# Altium schematic sheet Power-Sheet.SchDoc
size 420 x 297 mm; SheetNumber: 2; SheetTotal: 6
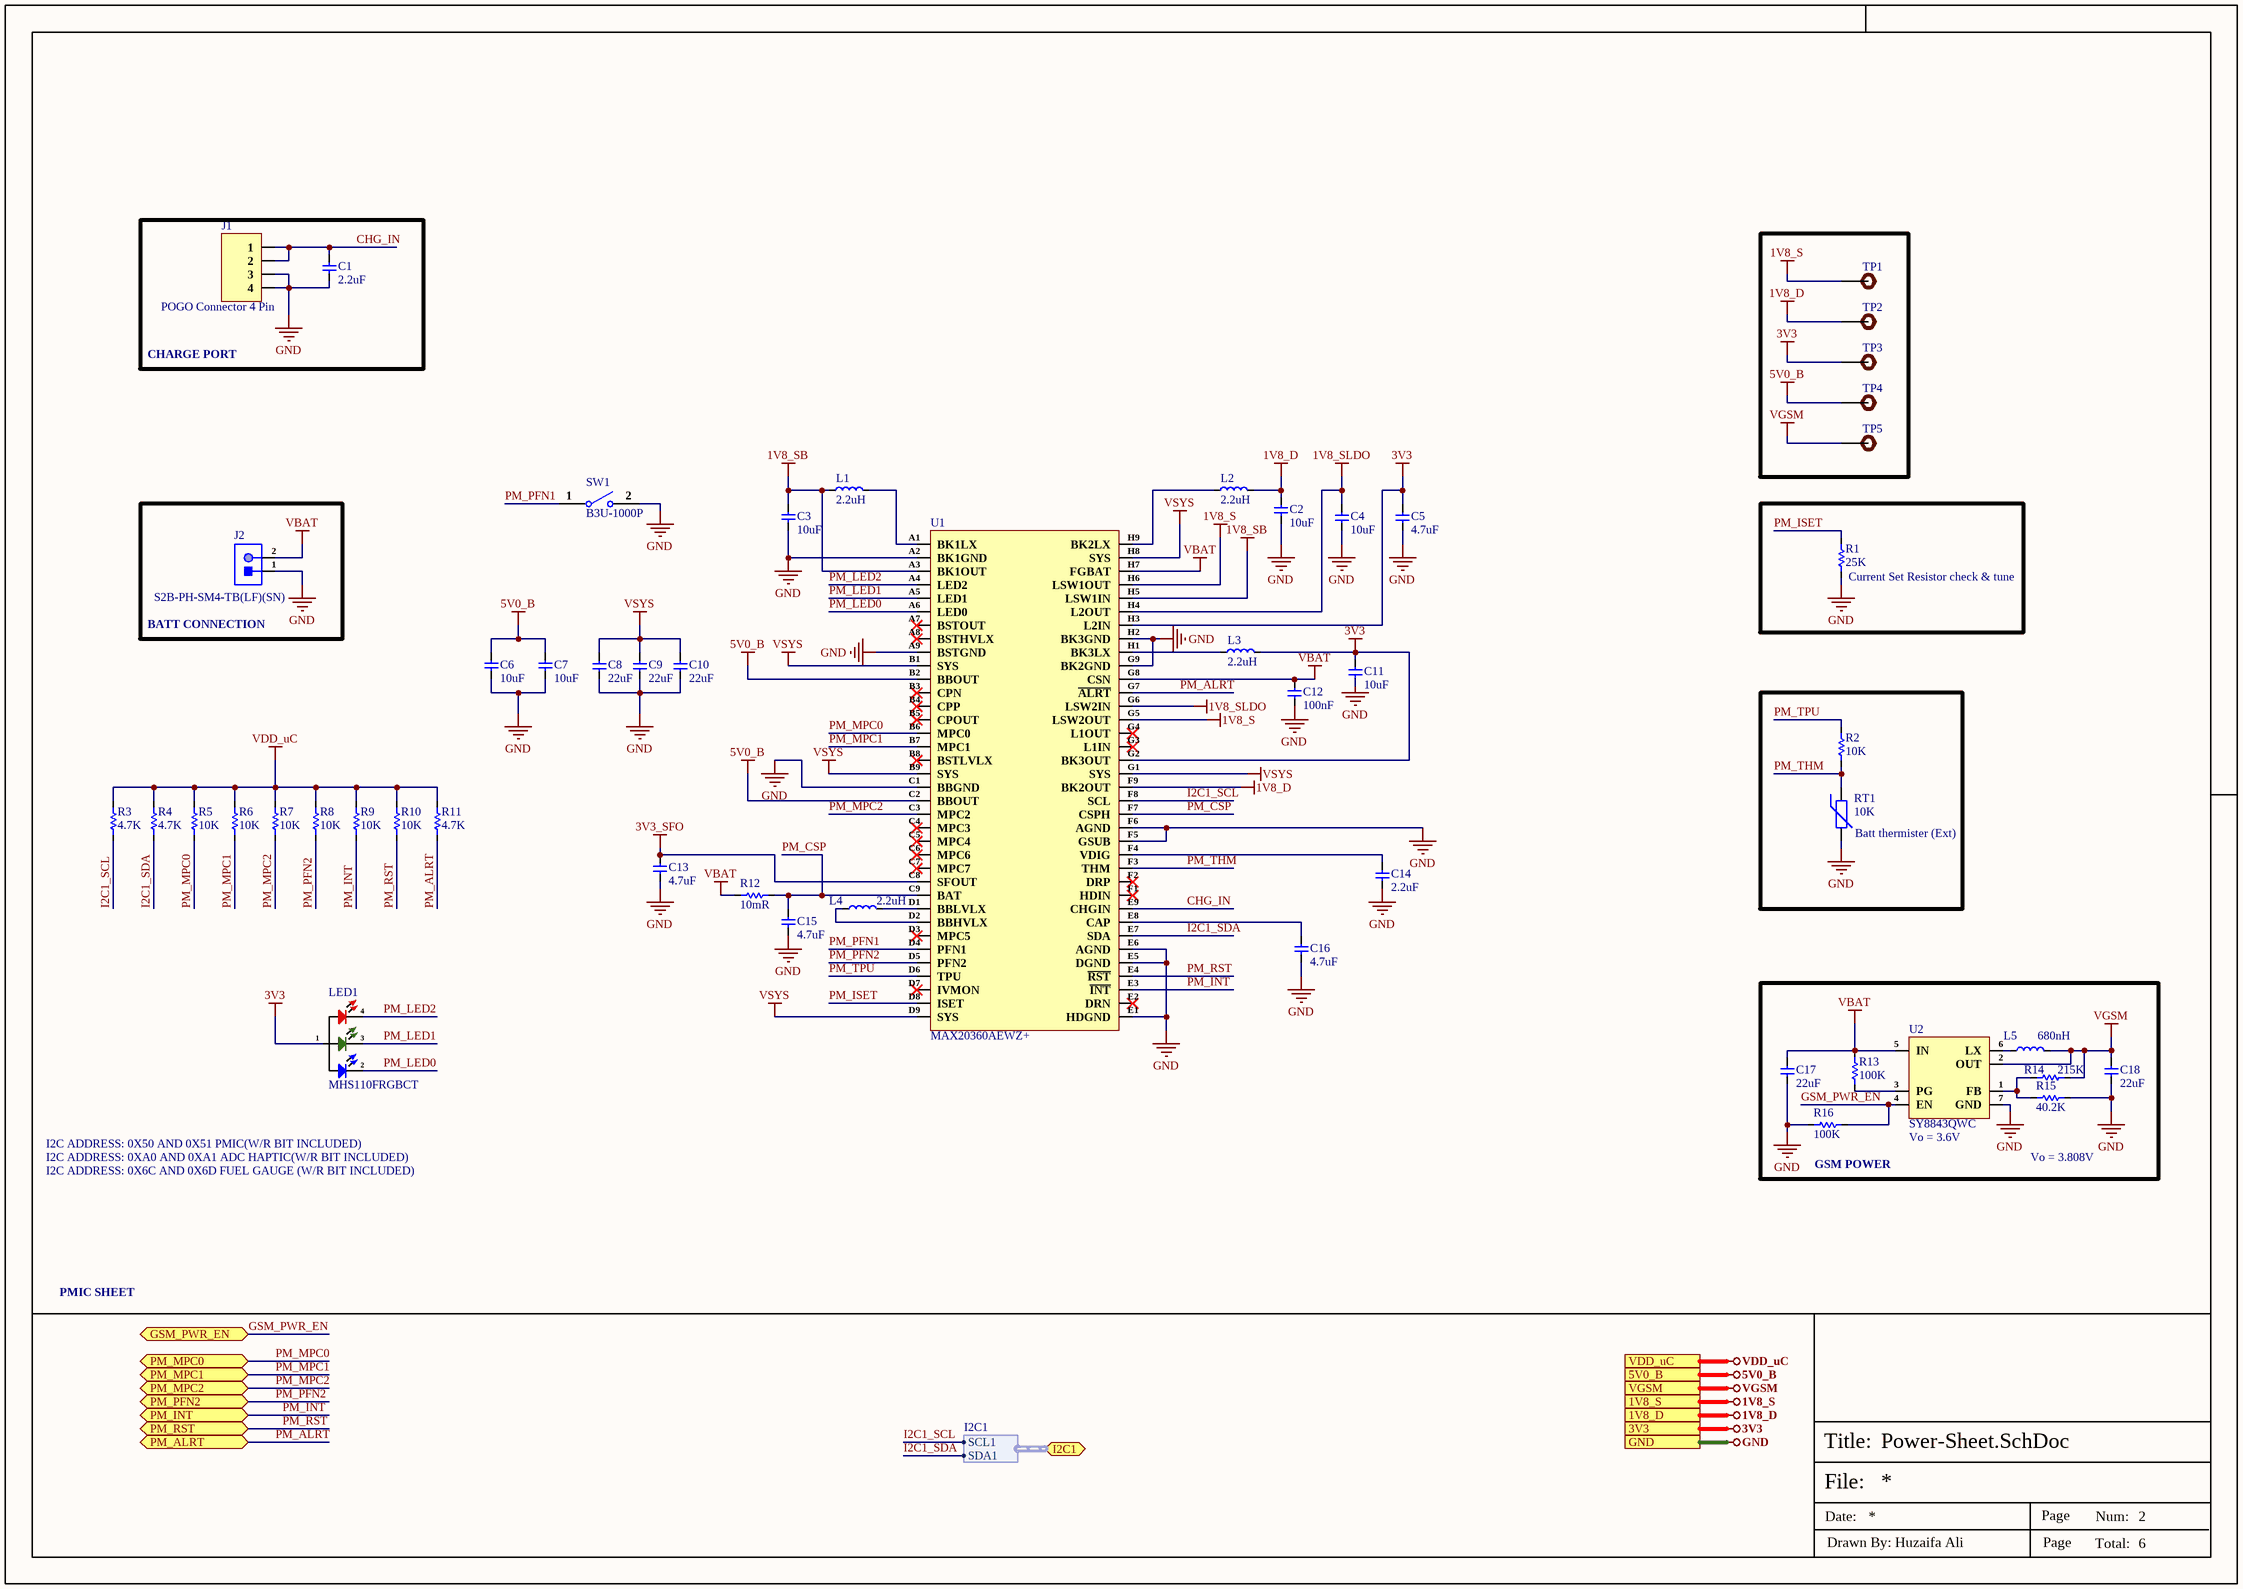
[diagram p0: Power-Sheet.SchDoc]

## Parts
C1  2.2uF  [Cap-0402]
C2  10uF  [Cap-0603]
C3  10uF  [Cap-0603]
C4  10uF  [Cap-0603]
C5  4.7uF  [Cap-0402]
C6  10uF  [Cap-0603]
C7  10uF  [Cap-0603]
C8  22uF  [Cap-0603]
C9  22uF  [Cap-0603]
C10  22uF  [Cap-0603]
C11  10uF  [Cap-0603]
C12  100nF  [Cap-0402]
C13  4.7uF  [Cap-0402]
C14  2.2uF  [Cap-0402]
C15  4.7uF  [Cap-0402]
C16  4.7uF  [Cap-0402]
C17  22uF  [Cap-0603]
C18  22uF  [Cap-0603]
J1  POGO Connector 4 Pin  [Pogo 4 Pin]
J2  S2B-PH-SM4-TB(LF)(SN)  [S2B-PH-SM4-TB(LF)(SN)]
L1  2.2uH  [IND-0806]
L2  2.2uH  [IND-0806]
L3  2.2uH  [IND-0806]
L4  2.2uH  [IND-0806]
L5  680nH  [UHP252012NF-R68MT01]
LED1  MHS110FRGBCT  [MHS110FRGBCT]
R1  25K  [Res-0603]
R2  10K  [Res-0402]
R3  4.7K  [Res-0201]
R4  4.7K  [Res-0201]
R5  10K  [Res-0402]
R6  10K  [Res-0402]
R7  10K  [Res-0402]
R8  10K  [Res-0402]
R9  10K  [Res-0402]
R10  10K  [Res-0402]
R11  4.7K  [Res-0402]
R12  10mR  [Res-0402]
R13  100K  [Res-0402]
R14  215K  [Res-0603]
R15  40.2K  [Res-0402]
R16  100K  [Res-0402]
RT1  10K  [Res-0201]
SW1  B3U-1000P  [B3U-1000P]
TP1  TEST POINT 0.5mm Dia  [Test-point - 0.5mm]  (value not drawn)  (no BOM)
TP2  TEST POINT 0.5mm Dia  [Test-point - 0.5mm]  (value not drawn)  (no BOM)
TP3  TEST POINT 0.5mm Dia  [Test-point - 0.5mm]  (value not drawn)  (no BOM)
TP4  TEST POINT 0.5mm Dia  [Test-point - 0.5mm]  (value not drawn)  (no BOM)
TP5  TEST POINT 0.5mm Dia  [Test-point - 0.5mm]  (value not drawn)  (no BOM)
U1  MAX20360AEWZ+  [72-WLP (4.88x4.19)]
U2  SY8843QWC  [QFN-7(1.5x1.5)]

## Blocks framed on the sheet
CHARGE PORT: C1 J1
BATT CONNECTION: J2
Current Set Resistor check & tune: R1
Batt thermister (Ext): R2 RT1

## Ports
1V8_D (see Top-Sheet[2B], Sensor-Sheet[5D]), 1V8_S (see Top-Sheet[2B], Controller-Sheet[5D], Sensor-Sheet[5D], Temp-Sensor-Sheet[3D]), 3V3 (see Top-Sheet[2B], Controller-Sheet[5D], Sensor-Sheet[5D]), 5V0_B (see Top-Sheet[2A], Controller-Sheet[5D], Sensor-Sheet[5D]), GND (see Top-Sheet[2A], Controller-Sheet[5D], GSM-Sheet[5D], Sensor-Sheet[5D], Temp-Sensor-Sheet[3D]), GSM_PWR_EN (bidir, see Top-Sheet[2B], Controller-Sheet[1D]), I2C1 (bidir, harness I2C1, see Top-Sheet[2B], Controller-Sheet[4D], Temp-Sensor-Sheet[2D]), PM_ALRT (bidir, see Top-Sheet[2B], Controller-Sheet[1D]), PM_INT (bidir, see Top-Sheet[2B], Controller-Sheet[1D]), PM_MPC0 (bidir, see Top-Sheet[2A], Controller-Sheet[1D]), PM_MPC1 (bidir, see Top-Sheet[2A], Controller-Sheet[1D]), PM_MPC2 (bidir, see Top-Sheet[2B], Controller-Sheet[1D]), PM_PFN2 (bidir, see Top-Sheet[2B], Controller-Sheet[1D]), PM_RST (bidir, see Top-Sheet[2B], Controller-Sheet[1D]), VDD_uC (see Top-Sheet[2B], Controller-Sheet[5D], GSM-Sheet[5D]), VGSM (see Top-Sheet[2B], GSM-Sheet[5D])

## Harnesses
I2C1: SCL1, SDA1

## Nets
1V8_D: C2.1 L2.2 TP2.1 U1.F9(BK2OUT) ; port 1V8_D
1V8_S: TP1.1 U1.G5(LSW2OUT) U1.H6(LSW1OUT) ; port 1V8_S
1V8_SB: C3.1 L1.1 U1.A3(BK1OUT) U1.H5(LSW1IN)
1V8_SLDO: C4.2 U1.G6(LSW2IN) U1.H4(L2OUT)
3V3: C5.2 C11.1 L3.2 LED1.1(+) TP3.1 U1.G2(BK3OUT) U1.H3(L2IN) ; port 3V3
3V3_SFO: C13.2 U1.C8(SFOUT)
5V0_B: C6.1 C7.1 TP4.1 U1.B2(BBOUT) U1.C2(BBOUT) ; port 5V0_B
GND: C1.1 C2.2 C3.2 C4.1 C5.1 C6.2 C7.2 C8.1 C9.1 C10.1 C11.2 C12.1 C13.1 C14.1 C15.2 C16.2 C17.1 C18.1 J1.3 J1.4 J2.1 R1.1 R15.2 R16.2 RT1.2 SW1.2 U1.A2(BK1GND) U1.A9(BSTGND) U1.C1(BBGND) U1.E1(HDGND) U1.E5(DGND) U1.E6(AGND) U1.F5(GSUB) U1.F6(AGND) U1.G9(BK2GND) U1.H2(BK3GND) U2.7(GND) ; port GND
VBAT: C12.2 C17.2 J2.2 R12.1 R13.2 U1.G8(CSN) U1.H7(FGBAT) U2.5(IN)
VDD_uC: R3.2 R4.2 R5.2 R6.2 R7.2 R8.2 R9.2 R10.2 R11.2 ; port VDD_uC
VGSM: C18.2 L5.2 R14.2 TP5.1 U2.2(OUT) ; port VGSM
VSYS: C8.2 C9.2 C10.2 U1.B1(SYS) U1.B9(SYS) U1.D9(SYS) U1.G1(SYS) U1.H8(SYS)
CHG_IN: C1.2 J1.1 J1.2 U1.E9(CHGIN)
GSM_PWR_EN: R16.1 U2.4(EN) ; port GSM_PWR_EN
I2C1_SCL: R3.1 U1.F8(SCL) ; port I2C1.SCL1
I2C1_SDA: R4.1 U1.E7(SDA) ; port I2C1.SDA1
PM_ALRT: R11.1 U1.G7(~{ALRT}) ; port PM_ALRT
PM_CSP: C15.1 R12.2 U1.C9(BAT) U1.F7(CSPH)
PM_INT: R9.1 U1.E3(~{INT}) ; port PM_INT
PM_ISET: R1.2 U1.D8(ISET)
PM_LED0: LED1.2(-BLUE) U1.A6(LED0)
PM_LED1: LED1.3(-GREEN) U1.A5(LED1)
PM_LED2: LED1.4(-RED) U1.A4(LED2)
PM_MPC0: R5.1 U1.B6(MPC0) ; port PM_MPC0
PM_MPC1: R6.1 U1.B7(MPC1) ; port PM_MPC1
PM_MPC2: R7.1 U1.C3(MPC2) ; port PM_MPC2
PM_PFN1: SW1.1 U1.D4(PFN1)
PM_PFN2: R8.1 U1.D5(PFN2) ; port PM_PFN2
PM_RST: R10.1 U1.E4(~{RST}) ; port PM_RST
PM_THM: R2.1 RT1.1 U1.F3(THM)
PM_TPU: R2.2 U1.D6(TPU)
NetC14_2: C14.2 U1.F4(VDIG)
NetC16_1: C16.1 U1.E8(CAP)
NetL1_2: L1.2 U1.A1(BK1LX)
NetL2_1: L2.1 U1.H9(BK2LX)
NetL3_1: L3.1 U1.H1(BK3LX)
NetL4_1: L4.1 U1.D2(BBHVLX)
NetL4_2: L4.2 U1.D1(BBLVLX)
NetL5_1: L5.1 U2.6(LX)
NetR13_1: R13.1 U2.3(PG)
NetR14_1: R14.1 R15.1 U2.1(FB)

Not connected (* = marked no-connect by the designer): U1 A7(BSTOUT)* A8(BSTHVLX)* B3(CPN)* B4(CPP)* B5(CPOUT)* B8(BSTLVLX)* C4(MPC3)* C5(MPC4)* C6(MPC6)* C7(MPC7)* D3(MPC5)* D7(IVMON)* E2(DRN)* F1(HDIN)* F2(DRP)* G3(L1IN)* G4(L1OUT)*

## Notes on the sheet
- I2C ADDRESS: 0X50 AND 0X51 PMIC(W/R BIT INCLUDED)
- I2C ADDRESS: 0XA0 AND 0XA1 ADC HAPTIC(W/R BIT INCLUDED)
- I2C ADDRESS: 0X6C AND 0X6D FUEL GAUGE (W/R BIT INCLUDED)
- (near R16) GSM POWER
- (near U2) Vo = 3.6V
- Vo = 3.808V
- PMIC SHEET
- File:
- Title:
- Date:
- Page
- Num:
- Total:
- Drawn By: Huzaifa Ali

## Library data of the parts
C1 = C1005X5R1V225K050BC: CAP CER 2.2UF 35V X5R 0402; Manufacturer: TDK; Item Type: Capacitors; Dielectric Material: Ceramic; Material: 4241ConductorMaterial; Tolerance: 10%; Supplier: Digikey; Supplier Part Number: 445-9028-1-ND; Manufacturer Part Number: C1005X5R1V225K050BC; RoHS: Yes; Stock: 1458755; Pricing: 1=0.21, 10=0.123, 50=0.0866, 100=0.0754, 500=0.05646, 1000=0.05055, 2500=0.04429, 5000=0.04049 (USD); Mounting Technology: Surface Mount; Case/Package: 0402; Case Code (Imperial): 0402; Case Code (Metric): 1005; Weight: 2.3E-05oz; Min Operating Temperature: -55°C; Max Operating Temperature: 85°C; Packaging: Tape and Reel; Voltage Rating: 35V; Value: 2.2uF; Voltage Rating (DC): 35V; Package Quantity: 1; Dielectric: X5R; Termination: SMD/SMT; Series: C; Length: 1mm; Width: 0.02inch; Height: 0.5mm; Thickness: 0.022inch; Depth: 0.5mm; Lead Free: Lead Free; RoHS Compliant: Yes; Reach SVHC Compliant: Unknown; ComponentLink1URL: https://datasheet.ciiva.com/24218/mlcc-commercial-general-en-24218938.pdf?src-supplier=Mouser; ComponentLink1Description: https://datasheet.ciiva.com/24218/mlcc-commercial-general-en-24218938.pdf?src-supplier=Mouser
C2-C4 C6 C7 C11 = GRT188R61E106ME13D: CAP CER 10UF 25V X5R 0603; Manufacturer: Murata; Item Type: Capacitors; Material: 4241ConductorMaterial; Tolerance: 20%; Supplier: Future Electronics; LCSC Part Number: C697423; Manufacturer Part Number: GRT188R61E106ME13D; RoHS: No; Stock: 444000; Pricing: 4000=0.0522, 8000=0.0514, 12000=0.0509, 20000=0.0503, 40000=0.049 (USD); Mounting Technology: Surface Mount; Case/Package: 0603; Case Code (Metric): 1608; Case Code (Imperial): 0603; Weight: 0.000917oz; Min Operating Temperature: -55°C; Max Operating Temperature: 85°C; Packaging: Cut Tape; Value: 10uF; Voltage Rating: 25V; Series: GRT; Termination: Standard; Voltage Rating (DC): 25V; Dielectric: X5R; Package Quantity: 4000; Length: 1.6mm; Width: 0.8mm; Height: 0.8mm; Ratings: AEC-Q200; RoHS Compliant: No; ComponentLink1URL: https://datasheet.octopart.com/GRT188R61E106ME13D-Murata-datasheet-149523595.pdf?src-supplier=Newark; ComponentLink1Description: https://datasheet.octopart.com/GRT188R61E106ME13D-Murata-datasheet-149523595.pdf?src-supplier=Newark; ComponentLink2URL: https://datasheet.octopart.com/GRT188R61E106ME13D-Murata-datasheet-82944876.pdf?src-supplier=Future+Electronics; ComponentLink2Description: https://datasheet.octopart.com/GRT188R61E106ME13D-Murata-datasheet-82944876.pdf?src-supplier=Future+Electronics; ComponentLink3URL: http://search.murata.co.jp/Ceramy/image/img/A01X/G101/ENG/GRT188R61E106ME13-01.pdf?src-supplier=Digikey; ComponentLink3Description: http://search.murata.co.jp/Ceramy/image/img/A01X/G101/ENG/GRT188R61E106ME13-01.pdf?src-supplier=Digikey; ComponentLink4URL: https://search.murata.co.jp/Ceramy/image/img/A01X/G101/ENG/GRT188R61E106ME13-01.pdf?src-supplier=Digikey; ComponentLink4Description: https://search.murata.co.jp/Ceramy/image/img/A01X/G101/ENG/GRT188R61E106ME13-01.pdf?src-supplier=Digikey; ComponentLink5URL: https://datasheet.octopart.com/GRT188R61E106ME13D-Murata-datasheet-165579666.pdf?src-supplier=TME; ComponentLink5Description: https://datasheet.octopart.com/GRT188R61E106ME13D-Murata-datasheet-165579666.pdf?src-supplier=TME
C5 C13 C15 C16 = C1005X5R0J475K050BC: CAP CER 4.7UF 6.3V X5R 0402; Manufacturer: TDK; Item Type: Capacitors; Material: 4241ConductorMaterial; Supplier: Digikey; Supplier Part Number: 445-5947-1-ND; Manufacturer Part Number: C1005X5R0J475K050BC; RoHS: Yes; Stock: 1033379; Pricing: 1=0.28, 10=0.165, 50=0.1178, 100=0.1032, 500=0.0782, 1000=0.07043, 2500=0.06217, 5000=0.05716 (USD); Dielectric Material: 4241ConductorMaterial; Lead Free: 5697LeadFree; ComponentLink1URL: https://datasheet.ciiva.com/6252/mlcc-commercial-general-en-6252115.pdf?src-supplier=Digikey; ComponentLink1Description: https://datasheet.ciiva.com/6252/mlcc-commercial-general-en-6252115.pdf?src-supplier=Digikey
C8-C10 = CL10A226MO7JZNC: CAP CER 22UF 16V X5R 0603; Manufacturer: Samsung; Item Type: Capacitors; Material: 4241ConductorMaterial; Tolerance: 20%; Supplier: Digikey; LCSC Part Number: C2762594; Manufacturer Part Number: CL10A226MO7JZNC; RoHS: Yes; Stock: 944984; Pricing: 1=0.65, 10=0.391, 50=0.2884, 100=0.2564, 500=0.20198, 1000=0.18499 (USD); Mounting Technology: Surface Mount; Case/Package: 0603; Case Code (Imperial): 0603; Case Code (Metric): 1608; Min Operating Temperature: -55°C; Max Operating Temperature: 85°C; Packaging: Cut Tape; Value: 22uF; Voltage Rating: 16V; Series: CL; Height: 900um; RoHS Compliant: Yes; ComponentLink1URL: http://www.samsungsem.com/kr/support/product-search/mlcc/CL10A226MO7JZNC.jsp?src-supplier=Digikey; ComponentLink1Description: http://www.samsungsem.com/kr/support/product-search/mlcc/CL10A226MO7JZNC.jsp?src-supplier=Digikey; ComponentLink2URL: https://datasheet.octopart.com/CL10A226MO7JZNC-Samsung-Electro-Mechanics-datasheet-149156497.pdf?src-supplier=Future+Electronics; ComponentLink2Description: https://datasheet.octopart.com/CL10A226MO7JZNC-Samsung-Electro-Mechanics-datasheet-149156497.pdf?src-supplier=Future+Electronics
C12 = GRM155R71H104KE14D: CAP CER 0.1UF 50V X7R 0402; Manufacturer: Murata; Item Type: Capacitors; Material: Ceramic; Tolerance: 10%; Dissipation Factor: 0.025%; Supplier: Future Electronics; LCSC Part Number: C77020; Manufacturer Part Number: GRM155R71H104KE14D; RoHS: Yes; Stock: 45820000; Pricing: 10000=0.0034, 40000=0.0033, 150000=0.0032, 250000=0.0031, 500000=0.003 (USD); Mounting Technology: Surface Mount; Case/Package: 0402; Pins: 2NUMBER; Case Code (Metric): 1005; Case Code (Imperial): 0402; Weight: 0.000212oz; Dielectric Material: Ceramic; Min Operating Temperature: -55°C; Max Operating Temperature: 125°C; Packaging: Tape and Reel; Dielectric: X7R; Value: 100nF; Voltage Rating: 50V; Termination: SMD/SMT; Voltage: 50V; Voltage Rating (DC): 50V; Package Quantity: 10000; Series: GRM; Construction: Flat; Length: 1mm; Width: 0.5mm; Height: 0.5mm; Thickness: 0.022inch; Depth: 0.5mm; Lead Free: 5697LeadFree; Reach SVHC Compliant: No; RoHS Compliant: Yes; ComponentLink1URL: http://www.farnell.com/datasheets/2079156.pdf?src-supplier=Farnell; ComponentLink1Description: http://www.farnell.com/datasheets/2079156.pdf?src-supplier=Farnell; ComponentLink2URL: http://www.mouser.com/ds/2/281/c02e-2905.pdf?src-supplier=Mouser; ComponentLink2Description: http://www.mouser.com/ds/2/281/c02e-2905.pdf?src-supplier=Mouser; ComponentLink3URL: https://datasheet.octopart.com/GRM155R71H104KE14D-Murata-datasheet-22122223.pdf?src-supplier=Future+Electronics; ComponentLink3Description: https://datasheet.octopart.com/GRM155R71H104KE14D-Murata-datasheet-22122223.pdf?src-supplier=Future+Electronics; ComponentLink4URL: http://www.farnell.com/datasheets/2079156.pdf?src-supplier=Newark; ComponentLink4Description: http://www.farnell.com/datasheets/2079156.pdf?src-supplier=Newark; ComponentLink5URL: https://datasheet.octopart.com/GRM155R71H104KE14D-Murata-datasheet-66077078.pdf?src-supplier=Element14; ComponentLink5Description: https://datasheet.octopart.com/GRM155R71H104KE14D-Murata-datasheet-66077078.pdf?src-supplier=Element14; ComponentLink6URL: https://search.murata.co.jp/Ceramy/image/img/A01X/G101/ENG/GRM155R71H104KE14-01.pdf?src-supplier=Digikey; ComponentLink6Description: https://search.murata.co.jp/Ceramy/image/img/A01X/G101/ENG/GRM155R71H104KE14-01.pdf?src-supplier=Digikey
C14 = C1005X5R0J225K050BC: CAP CER 2.2UF 6.3V X5R 0402; Manufacturer: TDK; Item Type: Capacitors; Dielectric Material: 4241ConductorMaterial; Supplier: Digikey; Supplier Part Number: 445-6847-1-ND; Manufacturer Part Number: C1005X5R0J225K050BC; RoHS: Yes; Stock: 1434689; Pricing: 1=0.18, 10=0.102, 50=0.0718, 100=0.0624, 500=0.04634, 1000=0.04135, 2500=0.03605, 5000=0.03284 (USD); Pins: 2NUMBER; Material: 4241ConductorMaterial; Lead Free: 5697LeadFree; ComponentLink1URL: https://datasheet.ciiva.com/24216/c1005x5r0j225k050bc-264406-24216408.pdf?src-supplier=Mouser; ComponentLink1Description: https://datasheet.ciiva.com/24216/c1005x5r0j225k050bc-264406-24216408.pdf?src-supplier=Mouser; ComponentLink2URL: https://datasheet.ciiva.com/23802/1796654-23802728.pdf?src-supplier=Newark; ComponentLink2Description: https://datasheet.ciiva.com/23802/1796654-23802728.pdf?src-supplier=Newark; ComponentLink3URL: https://datasheet.ciiva.com/28450/1796654-28450934.pdf?src-supplier=Element14; ComponentLink3Description: https://datasheet.ciiva.com/28450/1796654-28450934.pdf?src-supplier=Element14; ComponentLink4URL: https://datasheet.ciiva.com/28665/mlcc-commercial-general-en-28665478.pdf?src-supplier=Element14; ComponentLink4Description: https://datasheet.ciiva.com/28665/mlcc-commercial-general-en-28665478.pdf?src-supplier=Element14; ComponentLink5URL: https://datasheet.ciiva.com/6291/tdkmlcccaprange-6291126.pdf?src-supplier=Digikey; ComponentLink5Description: https://datasheet.ciiva.com/6291/tdkmlcccaprange-6291126.pdf?src-supplier=Digikey; ComponentLink6URL: https://datasheet.ciiva.com/6291/tdkmlcccaprange-6291128.pdf?src-supplier=Digikey; ComponentLink6Description: https://datasheet.ciiva.com/6291/tdkmlcccaprange-6291128.pdf?src-supplier=Digikey
C17 C18 = CC0603MRX5R5BB226: CAP CER 22UF 6.3V X5R 0603; Manufacturer: Yageo; Tolerance: 20%; Supplier 1: Mouser; Manufacturer Part Number: CC0603MRX5R5BB226; RoHS: Yes; Category: Ceramic Capacitors; Stock 1: 3030; Pricing 1: 1=0.33000, 10=0.22500, 50=0.22500, 100=0.12800, 1000=0.07900, 10000=0.06500 (USD); Mount: Surface Mount; Case/Package: 0603; Case Code (Metric): 1608; Case Code (Imperial): 0603; Weight: 7.1E-05oz; Min Operating Temperature: -55°C; Max Operating Temperature: 85°C; Capacitance: 22uF; Packaging: Tape and Reel; Dielectric: X5R; Voltage Rating: 6.3V; Termination: SMD/SMT; Resistor Type: Ceramic; Voltage Rating (DC): 6.3V; Package Quantity: 4000; Length: 0.063inch; Width: 0.031inch; Thickness: 0.035inch; Depth: 0.8mm; Lead Free: Lead Free; Halogen Free: Halogen Free; RoHS Compliant: Yes; ComponentLink1URL: http://www.mouser.com/ds/2/447/Yageo_UPY-GP_NP0_16V-to-50V_9-358835.pdf?src-supplier=Mouser; ComponentLink1Description: http://www.mouser.com/ds/2/447/Yageo_UPY-GP_NP0_16V-to-50V_9-358835.pdf?src-supplier=Mouser; ComponentLink2URL: http://www.yageo.com/documents/recent/UPY-GPHC_X5R_4V-to-50V_25.pdf?src-supplier=Digi-Key; ComponentLink2Description: http://www.yageo.com/documents/recent/UPY-GPHC_X5R_4V-to-50V_25.pdf?src-supplier=Digi-Key; Supplier Part Number 1: 603-CC603MRX5R5BB226; LCSC Part Number: C109448
J1 = POGO Connector 4 Pin: Pogo Pad 2.5mm 4 Pin; Item Type: Pogo Connector; Manufacturer Part Number: POGO Connector 4 Pin
J2 = S2B-PH-SM4-TB(LF)(SN): CONN HEADER SMD R/A 2POS 2MM; Manufacturer: JST; Item Type: Connectors; Voltage Rating: 100V; Current Rating: 3A; Insulation Resistance: 1GR; Number of Positions: 2; Gender: 29Gender; Number of Contacts: 2NUMBER; Max Current Rating: 2A; Contact Resistance: 20mR; Supplier: Future Electronics; LCSC Part Number: C295747; Manufacturer Part Number: S2B-PH-SM4-TB(LF)(SN); RoHS: No; Stock: 5000; Pricing: 1000=0.27, 2000=0.265, 3000=0.265, 4000=0.26, 5000=0.25 (USD); Mounting Technology: Surface Mount; Pins: 2NUMBER; Contact Material: Copper Alloy; Color: 46,47Colour; Contact Plating: 154ConductorMaterial; Housing Color: 50Colour; Housing Material: 4302ConductorMaterial; Weight: 28.349523g; Contact Shape: Square; Contact Finish - Mating: TIN; Insulation Material: Nylon; Insulation Color: Natural; Min Operating Temperature: -25°C; Max Operating Temperature: 85°C; Number of Rows: 1; Termination: Solder; Series: PH; Packaging: Cut Tape; Orientation: 5496OrientationType; Max Voltage Rating (AC): 100V; Voltage Rating (AC): 100V; Working Voltage: 100V; Connector Type: Header; Fastening Type: Detent; Contact Type: Male Pin; Voltage Rating (DC): 100V; Number of Poles: 2NUMBER; Length: 11.9mm; Width: 2.34mm; Height: 6mm; Pitch: 2mm; Depth: 7.6mm; Lead Pitch: 2mm; Contact Mating Length: 3.302mm; Flammability Rating: UL94 V-0; Reach SVHC Compliant: 4186SVHC; Lead Free: 5697LeadFree; ComponentLink1URL: http://www.farnell.com/datasheets/1699381.pdf?src-supplier=Farnell; ComponentLink1Description: http://www.farnell.com/datasheets/1699381.pdf?src-supplier=Farnell; ComponentLink2URL: http://datasheet.octopart.com/S2B-PH-SM4-TB-%28LF%29%28SN%29-JST-datasheet-12510261.pdf?src-supplier=Distrelec; ComponentLink2Description: http://datasheet.octopart.com/S2B-PH-SM4-TB-%28LF%29%28SN%29-JST-datasheet-12510261.pdf?src-supplier=Distrelec; ComponentLink3URL: http://www.farnell.com/datasheets/1699381.pdf?src-supplier=Newark; ComponentLink3Description: http://www.farnell.com/datasheets/1699381.pdf?src-supplier=Newark; ComponentLink4URL: https://datasheet.octopart.com/S2B-PH-SM4-TB%28LF%29%28SN%29-JST-datasheet-56537.pdf?src-supplier=Future+Electronics; ComponentLink4Description: https://datasheet.octopart.com/S2B-PH-SM4-TB%28LF%29%28SN%29-JST-datasheet-56537.pdf?src-supplier=Future+Electronics; ComponentLink5URL: http://www.farnell.com/datasheets/1699381.pdf?src-supplier=Element14; ComponentLink5Description: http://www.farnell.com/datasheets/1699381.pdf?src-supplier=Element14; ComponentLink6URL: https://datasheet.octopart.com/S2B-PH-SM4-TB-%28LF%29%28SN%29-JST-datasheet-12510261.pdf?src-supplier=TME; ComponentLink6Description: https://datasheet.octopart.com/S2B-PH-SM4-TB-%28LF%29%28SN%29-JST-datasheet-12510261.pdf?src-supplier=TME
L1-L4 = DFE201612E-2R2M=P2: FIXED IND 2.2UH 1.8A 116MOHM SMD; Manufacturer: Murata; Item Type: Inductors; Inductance Tolerance: 20%; Saturation Current: 2.4A; ESR: 116mR; Test Frequency: 1MHz; Supplier: Mouser; LCSC Part Number: C337893; Manufacturer Part Number: DFE201612E-2R2M=P2; RoHS: Yes; Stock: 140327; Pricing: 1=0.31, 10=0.202, 50=0.202, 100=0.158, 1000=0.145, 10000=0.104 (USD); Min Operating Temperature: -40°C; Max Operating Temperature: 125°C; Current Rating: 1.8A; Value: 2.2uH; Packaging: 13Packaging; RMS Current (Irms): 1.8A; Height: 1.2mm; ComponentLink1URL: http://www.farnell.com/datasheets/2339714.pdf?src-supplier=Farnell; ComponentLink1Description: http://www.farnell.com/datasheets/2339714.pdf?src-supplier=Farnell; ComponentLink2URL: https://search.murata.co.jp/Ceramy/image/img/P02/J(E)TE243A-0006.pdf?src-supplier=Digikey; ComponentLink2Description: https://search.murata.co.jp/Ceramy/image/img/P02/J(E)TE243A-0006.pdf?src-supplier=Digikey; ComponentLink3URL: http://www.farnell.com/datasheets/2339714.pdf?src-supplier=Newark; ComponentLink3Description: http://www.farnell.com/datasheets/2339714.pdf?src-supplier=Newark; ComponentLink4URL: https://datasheet.octopart.com/DFE201612E-2R2M%3DP2-Murata-datasheet-150582460.pdf?src-supplier=Arrow.cn; ComponentLink4Description: https://datasheet.octopart.com/DFE201612E-2R2M%3DP2-Murata-datasheet-150582460.pdf?src-supplier=Arrow.cn
L5 = UHP252012NF-R68MT01: 3A 680nH ±20% 1008 Power Inductors ROHS; Manufacturer: TAI-TECH; Manufacturer Part Number: UHP252012NF-R68MT01; Package: 1008; LCSC Part Number: C305246; Item Type: Inductor; ComponentLink1Description: LCSC; ComponentLink1URL: https://www.lcsc.com/product-detail/Power-Inductors_TAI-TECH-UHP252012NF-R68MT01_C305246.html.
LED1 = MHS110FRGBCT: Colorless transparence Side stickers -40℃~+85℃ Common anode RGB 120° 60mW SMD,1.5x3.2mm Light Emitting Diodes (LED) ROHS; Manufacturer: MEIHUA; Item Type: RGB LED; Manufacturer Part Number: MHS110FRGBCT; Package: SMD,1.5x3.2mm; LCSC Part Number: C496820; ComponentLink1Description: LCSC; ComponentLink1URL: https://www.lcsc.com/product-detail/Light-Emitting-Diodes-LED_MEIHUA-MHS110FRGBCT_C496820.html
R1 = AR03BTCX2502: 100mW Thin Film Resistor 50V ±25ppm/℃ ±0.1% 25kΩ 0603 Chip Resistor - Surface Mount ROHS; Manufacturer: Viking Tech; Manufacturer Part Number: AR03BTCX2502; Package: 0603; LCSC Part Number: C2828637; Item Type: Resistor; ComponentLink1Description: LCSC; ComponentLink1URL: https://www.lcsc.com/product-detail/Chip-Resistor-Surface-Mount_Viking-Tech-AR03BTCX2502_C2828637.html
R2 = HQ02WAJ0103TCE: 100mW 50V ±100ppm/℃ ±5% 10kΩ 0402 Chip Resistor - Surface Mount ROHS; Manufacturer: UNI-ROYAL; Manufacturer Part Number: HQ02WAJ0103TCE; Package: 0402; LCSC Part Number: C414854; Item Type: Resistor; ComponentLink1Description: LCSC; ComponentLink1URL: https://www.lcsc.com/product-detail/Chip-Resistor-Surface-Mount_UNI-ROYAL-Uniroyal-Elec-HQ02WAJ0103TCE_C414854.html
R3 R4 = RC0201FR-074K7L: RES 4.7K OHM 1% 1/20W 0201; Manufacturer: Yageo; Item Type: Resistor; Supplier: Future Electronics; Supplier Part Number: 7537285; Manufacturer Part Number: RC0201FR-074K7L; RoHS: Yes; Category: Chip SMD Resistors; Stock: 1610000; Pricing: 10000=0.0014, 50000=0.0013, 250000=0.0013, 750000=0.0012, 2000000=0.0011 (USD); ComponentLink1URL: https://datasheet.ciiva.com/2493/pyu-r-int-thick-7-2493811.pdf?src-supplier=Digi-Key; ComponentLink1Description: https://datasheet.ciiva.com/2493/pyu-r-int-thick-7-2493811.pdf?src-supplier=Digi-Key; ComponentLink2URL: https://datasheet.ciiva.com/2493/pyu-r-int-thick-7-2493812.pdf?src-supplier=Digi-Key; ComponentLink2Description: https://datasheet.ciiva.com/2493/pyu-r-int-thick-7-2493812.pdf?src-supplier=Digi-Key; ComponentLink3URL: https://datasheet.ciiva.com/2493/pyu-r-int-thick-7-2493813.pdf?src-supplier=Digi-Key; ComponentLink3Description: https://datasheet.ciiva.com/2493/pyu-r-int-thick-7-2493813.pdf?src-supplier=Digi-Key; ComponentLink4URL: https://datasheet.ciiva.com/8892/pyu-rc0201-51-rohs-l-8-8892942.pdf?src-supplier=Avnet; ComponentLink4Description: https://datasheet.ciiva.com/8892/pyu-rc0201-51-rohs-l-8-8892942.pdf?src-supplier=Avnet; ComponentLink5URL: https://datasheet.ciiva.com/7672/1563626-7672233.pdf?src-supplier=Element14; ComponentLink5Description: https://datasheet.ciiva.com/7672/1563626-7672233.pdf?src-supplier=Element14; LCSC Part Number: C138135
R5-R10 = RC0402FR-0710KL: RES 10K OHM 1% 1/16W 0402; Manufacturer: Yageo; Resistance: 10kR; Voltage Rating (DC): 50V; Temperature Coefficient: 100ppm/°C; Power Rating: 62.5mW; Max Power Dissipation: 63mW; Item Type: Resistor; Supplier 1: Mouser; Manufacturer Part Number: RC0402FR-0710KL; RoHS: Yes; Category: Chip SMD Resistors; Stock 1: 18648329; Pricing 1: 1=0.10000, 10=0.01400, 50=0.01400, 100=0.00500, 1000=0.00300, 10000=0.00200 (USD); Case/Package: 0402; Number of Pins: 2; Case Code (Imperial): 0402; Case Code (Metric): 1005; Min Operating Temperature: -55°C; Max Operating Temperature: 155°C; Resistor Type: Thick Film; Tolerance: 1%; Packaging: Tape and Reel; Voltage Rating: 50V; Termination: SMD/SMT; Working Voltage: 50V; Number of Terminations: 2; Features: Moisture Resistant; Series: RC; Resistance Tolerance: 1%; Construction: Rectangular; Length: 1mm; Width: 0.5mm; Height: 0.32mm; Depth: 0.5mm; Lead Pitch: 0.2mm; REACH SVHC: No SVHC; Lead Free: Lead Free; RoHS Compliant: Yes; Military Standard: Not; ComponentLink1URL: https://datasheet.ciiva.com/7660/38568-7660787.pdf?src-supplier=Element14; ComponentLink1Description: https://datasheet.ciiva.com/7660/38568-7660787.pdf?src-supplier=Element14; ComponentLink2URL: https://datasheet.ciiva.com/7849/1686128-7849814.pdf?src-supplier=Element14; ComponentLink2Description: https://datasheet.ciiva.com/7849/1686128-7849814.pdf?src-supplier=Element14; ComponentLink3URL: https://datasheet.ciiva.com/7983/1018594-7983486.pdf?src-supplier=Element14; ComponentLink3Description: https://datasheet.ciiva.com/7983/1018594-7983486.pdf?src-supplier=Element14; ComponentLink4URL: https://datasheet.ciiva.com/22747/1018594-22747512.pdf?src-supplier=Element14; ComponentLink4Description: https://datasheet.ciiva.com/22747/1018594-22747512.pdf?src-supplier=Element14; ComponentLink5URL: https://datasheet.ciiva.com/12667/pyu-rc0402-51-rohs-l-6-r-12667067.pdf?src-supplier=Mouser; ComponentLink5Description: https://datasheet.ciiva.com/12667/pyu-rc0402-51-rohs-l-6-r-12667067.pdf?src-supplier=Mouser; ComponentLink6URL: https://datasheet.ciiva.com/7849/1784430-7849813.pdf?src-supplier=Element14; ComponentLink6Description: https://datasheet.ciiva.com/7849/1784430-7849813.pdf?src-supplier=Element14; ComponentLink7URL: https://datasheet.ciiva.com/7849/1784430-7849815.pdf?src-supplier=Element14; ComponentLink7Description: https://datasheet.ciiva.com/7849/1784430-7849815.pdf?src-supplier=Element14; Supplier Part Number 1: 603-RC0402FR-0710KL; LCSC Part Number: C60490
R11 = RC0402FR-074K7L: RES 4.7K OHM 1% 1/16W 0402; Manufacturer: Yageo; Voltage Rating (DC): 50V; Power Rating: 62.5mW; Resistance: 4.7kR; Temperature Coefficient: 100ppm/°C; Max Power Dissipation: 63mW; Item Type: Resistor; Supplier 1: Avnet; Manufacturer Part Number: RC0402FR-074K7L; RoHS: Yes; Category: Chip SMD Resistors; Stock 1: 2420000; Pricing 1: 10000=0.00085 (USD); Case/Package: 0402; Number of Pins: 2; Case Code (Imperial): 0402; Case Code (Metric): 1005; Size Code: 0402; Min Operating Temperature: -55°C; Max Operating Temperature: 155°C; Tolerance: 1%; Voltage Rating: 50V; Packaging: Tape and Reel; Resistor Type: Thick Film; Termination: SMD/SMT; Features: Moisture Resistant; Series: RC; Number of Terminations: 2; Resistance Tolerance: 1%; Construction: Rectangular; Length: 1mm; Width: 0.5mm; Height: 0.32mm; Depth: 0.5mm; Height - Seated (Max): 0.016inch; RoHS Compliant: Yes; Reach SVHC Compliant: Yes; Military Standard: Not; Lead Free: Lead Free; ComponentLink1URL: https://datasheet.ciiva.com/22661/1686128-22661342.pdf?src-supplier=Element14; ComponentLink1Description: https://datasheet.ciiva.com/22661/1686128-22661342.pdf?src-supplier=Element14; ComponentLink2URL: https://datasheet.ciiva.com/7850/1018594-7850022.pdf?src-supplier=Element14; ComponentLink2Description: https://datasheet.ciiva.com/7850/1018594-7850022.pdf?src-supplier=Element14; ComponentLink3URL: https://datasheet.ciiva.com/7850/1018594-7850023.pdf?src-supplier=Element14; ComponentLink3Description: https://datasheet.ciiva.com/7850/1018594-7850023.pdf?src-supplier=Element14; ComponentLink4URL: https://datasheet.ciiva.com/15215/getdatasheetpartid-328119-15215035.pdf?src-supplier=Verical; ComponentLink4Description: https://datasheet.ciiva.com/15215/getdatasheetpartid-328119-15215035.pdf?src-supplier=Verical; Supplier Part Number 1: RC0402FR-074K7L; LCSC Part Number: C105871
R12 = PE0402FRF470R01L: RES 0.01 OHM 1% 1/4W 0402; Manufacturer: Yageo; Max Power Dissipation: 250mW; Temperature Coefficient: 100ppm/°C; Item Type: Resistor; Supplier: Digikey; Supplier Part Number: 13-PE0402FRF470R01LDKR-ND; Manufacturer Part Number: PE0402FRF470R01L; RoHS: Yes; Category: Chip SMD Resistors; Pricing: 1=0.87, 10=0.719, 25=0.666, 50=0.6086, 100=0.5006, 250=0.45928, 500=0.3812, 1000=0.31002, 5000=0.29578 (USD); Case/Package: 0402; Min Operating Temperature: -55°C; Max Operating Temperature: 125°C; Package Quantity: 10000; Packaging: Tape and Reel; Value: 10mR; Number of Terminations: 2; Tolerance: 1%; Features: Moisture Resistant,Automotive AEC-Q200; Series: PE; Length: 0.039inch; Width: 0.02inch; Height: 0.02inch; ComponentLink1URL: http://www.mouser.com/ds/2/447/PYu-PE_521_RoHS_L_3-771548.pdf?src-supplier=Mouser; ComponentLink1Description: http://www.mouser.com/ds/2/447/PYu-PE_521_RoHS_L_3-771548.pdf?src-supplier=Mouser; ComponentLink2URL: http://www.yageo.com/documents/recent/PYu-PE_521_RoHS_L_5.pdf?src-supplier=Digikey; ComponentLink2Description: http://www.yageo.com/documents/recent/PYu-PE_521_RoHS_L_5.pdf?src-supplier=Digikey; LCSC Part Number: C851613
R13 R16 = RC0402FR-07100KL: RES 100K OHM 1% 1/16W 0402; Manufacturer: Yageo; Resistance: 100kR; Temperature Coefficient: 100ppm/°C; Power Rating: 63mW; Voltage Rating: 50V; Item Type: Resistor; Supplier 1: Mouser; Manufacturer Part Number: RC0402FR-07100KL; RoHS: Yes; Category: Chip SMD Resistors; Stock 1: 7759549; Pricing 1: 1=0.10000, 10=0.01200, 50=0.01200, 100=0.00500, 1000=0.00300, 2500=0.00200, 10000=0.00100 (USD); Case/Package: 0402; Case Code (Metric): 1005; Case Code (Imperial): 0402; Min Operating Temperature: -55°C; Max Operating Temperature: 155°C; Resistor Type: Thick Film; Tolerance: 1%; Packaging: Tape and Reel; Package Quantity: 1; Number of Terminations: 2; Termination: SMD/SMT; Max Power Dissipation: 63mW; Working Voltage: 50V; Features: Moisture Resistant; Series: RC; Resistance Tolerance: 1%; Construction: Rectangular; Technology: THICK FILM; Length: 0.039inch; Width: 0.02inch; Height: 0.016inch; Depth: 0.5mm; REACH SVHC: No SVHC; Lead Free: Lead Free; RoHS Compliant: Yes; Military Standard: Not; ComponentLink1URL: https://datasheet.ciiva.com/11819/0900766b80c66297-11819452.pdf?src-supplier=RSComponents; ComponentLink1Description: https://datasheet.ciiva.com/11819/0900766b80c66297-11819452.pdf?src-supplier=RSComponents; ComponentLink2URL: https://datasheet.ciiva.com/22747/1018594-22747509.pdf?src-supplier=Element14; ComponentLink2Description: https://datasheet.ciiva.com/22747/1018594-22747509.pdf?src-supplier=Element14; ComponentLink3URL: https://datasheet.ciiva.com/2453/pyu-r-int-thick-7-2453362.pdf?src-supplier=Digi-Key; ComponentLink3Description: https://datasheet.ciiva.com/2453/pyu-r-int-thick-7-2453362.pdf?src-supplier=Digi-Key; ComponentLink4URL: https://datasheet.ciiva.com/2453/pyu-r-int-thick-7-2453363.pdf?src-supplier=Digi-Key; ComponentLink4Description: https://datasheet.ciiva.com/2453/pyu-r-int-thick-7-2453363.pdf?src-supplier=Digi-Key; ComponentLink5URL: https://datasheet.ciiva.com/2453/pyu-r-int-thick-7-2453361.pdf?src-supplier=Digi-Key; ComponentLink5Description: https://datasheet.ciiva.com/2453/pyu-r-int-thick-7-2453361.pdf?src-supplier=Digi-Key; ComponentLink6URL: https://datasheet.ciiva.com/12667/pyu-rc0402-51-rohs-l-6-r-12667930.pdf?src-supplier=Mouser; ComponentLink6Description: https://datasheet.ciiva.com/12667/pyu-rc0402-51-rohs-l-6-r-12667930.pdf?src-supplier=Mouser; ComponentLink7URL: https://datasheet.ciiva.com/15189/getdatasheetpartid-323696-15189334.pdf?src-supplier=Verical; ComponentLink7Description: https://datasheet.ciiva.com/15189/getdatasheetpartid-323696-15189334.pdf?src-supplier=Verical; Supplier Part Number 1: 603-RC0402FR-07100KL; LCSC Part Number: C60491
R14 = RC0603FR-07215KL: RES 215K OHM 1% 1/10W 0603; Manufacturer: Yageo; Voltage Rating (DC): 50V; Item Type: Resistor; Supplier: Future Electronics; Supplier Part Number: 9235490; Manufacturer Part Number: RC0603FR-07215KL; RoHS: Yes; Category: Chip SMD Resistors; Stock: 395000; Pricing: 5000=0.0014, 75000=0.0013, 200000=0.0013, 750000=0.0012, 2000000=0.0011 (USD); ComponentLink1URL: https://datasheet.ciiva.com/2553/pyu-r-int-thick-7-2553530.pdf?src-supplier=Digi-Key; ComponentLink1Description: https://datasheet.ciiva.com/2553/pyu-r-int-thick-7-2553530.pdf?src-supplier=Digi-Key; ComponentLink2URL: https://datasheet.ciiva.com/2553/pyu-r-int-thick-7-2553531.pdf?src-supplier=Digi-Key; ComponentLink2Description: https://datasheet.ciiva.com/2553/pyu-r-int-thick-7-2553531.pdf?src-supplier=Digi-Key; ComponentLink3URL: https://datasheet.ciiva.com/2553/pyu-r-int-thick-7-2553532.pdf?src-supplier=Digi-Key; ComponentLink3Description: https://datasheet.ciiva.com/2553/pyu-r-int-thick-7-2553532.pdf?src-supplier=Digi-Key; ComponentLink4URL: https://datasheet.ciiva.com/15189/getdatasheetpartid-323775-15189654.pdf?src-supplier=Verical; ComponentLink4Description: https://datasheet.ciiva.com/15189/getdatasheetpartid-323775-15189654.pdf?src-supplier=Verical; LCSC Part Number: C185350
R15 = 0402WGF4022TCE: 62.5mW Thick Film Resistors 50V ±100ppm/℃ ±1% 40.2kΩ 0402 Chip Resistor - Surface Mount ROHS; Manufacturer: Uniroyal; Supplier: LCSC; LCSC Part Number: C25893; Manufacturer Part Number: 0402WGF4022TCE; RoHS: No; Item Type: Resistor
RT1 = NCP03XH103J05RL: Thermistor NTC 10K Ohm 5% 2-Pin 0201 Surface Mount Solder Pad 3434K Paper T/R; Manufacturer: Murata; Item Type: Thermistors; Power Rating: 100mW; Current Rating: 310uA; Value: 10kR; Accuracy: 1%; Max Current Rating: 100uA; Voltage Rating: 5V; Supplier: Future Electronics; LCSC Part Number: C914154; Manufacturer Part Number: NCP03XH103J05RL; RoHS: Yes; Stock: 15000; Pricing: 15000=0.0365, 30000=0.0359, 45000=0.0356, 60000=0.0354, 75000=0.0347 (USD); Mounting Technology: Surface Mount; Case/Package: 0201; Pins: 2; Case Code (Metric): 0603; Case Code (Imperial): 0201; Min Operating Temperature: -40°C; Max Operating Temperature: 125°C; Tolerance: 5%; Packaging: Tape and Reel; Package Quantity: 1; Termination: SMD/SMT; Max Power Dissipation: 100mW; Series: NCP03; Resistance Tolerance: 5%; Length: 0.6mm; Height: 0.3mm; Depth: 0.3mm; Lead Free: Lead Free; RoHS Compliant: Yes; ComponentLink1URL: https://datasheet.ciiva.com/30488/0900766b81259d06-30488178.pdf?src-supplier=Rs; ComponentLink1Description: https://datasheet.ciiva.com/30488/0900766b81259d06-30488178.pdf?src-supplier=Rs; ComponentLink2URL: https://datasheet.ciiva.com/2848/ncp03-spec-2848344.pdf?src-supplier=Digikey; ComponentLink2Description: https://datasheet.ciiva.com/2848/ncp03-spec-2848344.pdf?src-supplier=Digikey; ComponentLink3URL: https://datasheet.ciiva.com/2848/ncp03-spec-2848345.pdf?src-supplier=Digikey; ComponentLink3Description: https://datasheet.ciiva.com/2848/ncp03-spec-2848345.pdf?src-supplier=Digikey; ComponentLink4URL: https://datasheet.ciiva.com/2848/ncp03-spec-2848343.pdf?src-supplier=Digikey; ComponentLink4Description: https://datasheet.ciiva.com/2848/ncp03-spec-2848343.pdf?src-supplier=Digikey
SW1 = B3U-1000P: SWITCH TACTILE SPST-NO 0.05A 12V; Manufacturer: Omron; Mechanical Life: 200000Cycles; Operating Force: 1.5N; Throw Configuration: SPST; Current Rating: 50mA; Contact Resistance: 100mR; Illumination Type: Non-Illuminated,Illuminated; Switch Travel: 0.15mm; Switch Function: Off-Mom; Actuator Type: Standard; Actuator Length: 0.4mm; Ratings: Dust Proof,IP40; ComponentLink1URL: http://www.farnell.com/datasheets/60838.pdf?src-supplier=Farnell; ComponentLink1Description: http://www.farnell.com/datasheets/60838.pdf?src-supplier=Farnell; ComponentLink2URL: http://www.farnell.com/datasheets/60838.pdf?src-supplier=Element14; ComponentLink2Description: http://www.farnell.com/datasheets/60838.pdf?src-supplier=Element14; ComponentLink3URL: https://omronfs.omron.com/en_US/ecb/products/pdf/en-b3u.pdf?src-supplier=Digi-Key; ComponentLink3Description: https://omronfs.omron.com/en_US/ecb/products/pdf/en-b3u.pdf?src-supplier=Digi-Key; ComponentLink4URL: http://www.omron.com/ecb/products/pdf/en-b3u.pdf?src-supplier=Digi-Key; ComponentLink4Description: http://www.omron.com/ecb/products/pdf/en-b3u.pdf?src-supplier=Digi-Key; ComponentLink5URL: https://www.distrelec.biz/Web/Downloads/he/et/B3U_eng_datasheet.pdf?mime=application%2Fpdf&src-supplier=Distrelec; ComponentLink5Description: https://www.distrelec.biz/Web/Downloads/he/et/B3U_eng_datasheet.pdf?mime=application%2Fpdf&src-supplier=Distrelec; ComponentLink6URL: http://www.onlinecomponents.com/productFiles/mf-OM/en-b3u.pdf?src-supplier=Onlinecomponents.com; ComponentLink6Description: http://www.onlinecomponents.com/productFiles/mf-OM/en-b3u.pdf?src-supplier=Onlinecomponents.com; Supplier 1: Digi-Key; Manufacturer Part Number: B3U-1000P; Stock 1: 116454; Pricing 1: 1=1, 10=0.961, 25=0.9064, 50=0.7976, 100=0.7251, 250=0.68888, 500=0.67074, 1000=0.52571 (USD); Mount: Surface Mount; Weight: 0.000776oz; Contact Material: Silver; Min Operating Temperature: -25°C; Max Operating Temperature: 70°C; Packaging: Tape and Reel; Voltage Rating (DC): 12V; Package Quantity: 1; Max Current Rating: 50mA; Termination: SMD/SMT; Orientation: Straight; Max Voltage Rating (DC): 12V; Electrical Life: 200000Cycles; Insulation Resistance: 100MR; Contact Current Rating: 50mA; Length: 4mm; Height: 1.2mm; Depth: 2.5mm; Width: 3mm; REACH SVHC: Unknown; Lead Free: Lead Free; ComponentLink7URL: https://www.verical.com/server-webapp/html/getDatasheet?partID=552554&src-supplier=Verical; ComponentLink7Description: https://www.verical.com/server-webapp/html/getDatasheet?partID=552554&src-supplier=Verical; ComponentLink8URL: http://www.farnell.com/datasheets/1685550.pdf?src-supplier=Element14; ComponentLink8Description: http://www.farnell.com/datasheets/1685550.pdf?src-supplier=Element14; ComponentLink9URL: http://www.farnell.com/datasheets/2610940.pdf?src-supplier=Farnell; ComponentLink9Description: http://www.farnell.com/datasheets/2610940.pdf?src-supplier=Farnell; ComponentLink10URL: https://www.alliedelec.com/m/d/4c8a9ef82804fc3c241a13c1e298fd73.pdf?src-supplier=Allied+Electronics; ComponentLink10Description: https://www.alliedelec.com/m/d/4c8a9ef82804fc3c241a13c1e298fd73.pdf?src-supplier=Allied+Electronics; Supplier Part Number 1: SW1020DKR-ND; LCSC Part Number: C231329; Item Type: Switch
TP1-TP5 = TEST POINT 0.5mm Dia: Test Point ON; Item Type: Test Point; Manufacturer Part Number: TEST POINT 0.5mm Dia
U1 = MAX20360AEWZ+: IC BATT FUEL LI-ION 1C 72WLP; Manufacturer: Analog Devices; Supplier: Digikey; Supplier Part Number: 505-MAX20360AEWZ+-ND; Manufacturer Part Number: MAX20360AEWZ+; Item Type: IC
U2 = SY8843QWC: Step-down type Fixed 1.8V 2.7V~5.5V 3A QFN-7(1.5x1.5) DC-DC Converters ROHS; Manufacturer: Silergy Corp; Item Type: IC; Manufacturer Part Number: SY8843QWC; Package: QFN-7(1.5x1.5); LCSC Part Number: C3151906; ComponentLink1Description: LCSC; ComponentLink1URL: https://www.lcsc.com/product-detail/DC-DC-Converters_Silergy-Corp-SY8843QWC_C3151906.html